# Altium schematic sheet 02_10_POWER_INPUT.SchDoc
size 289 x 396 mm
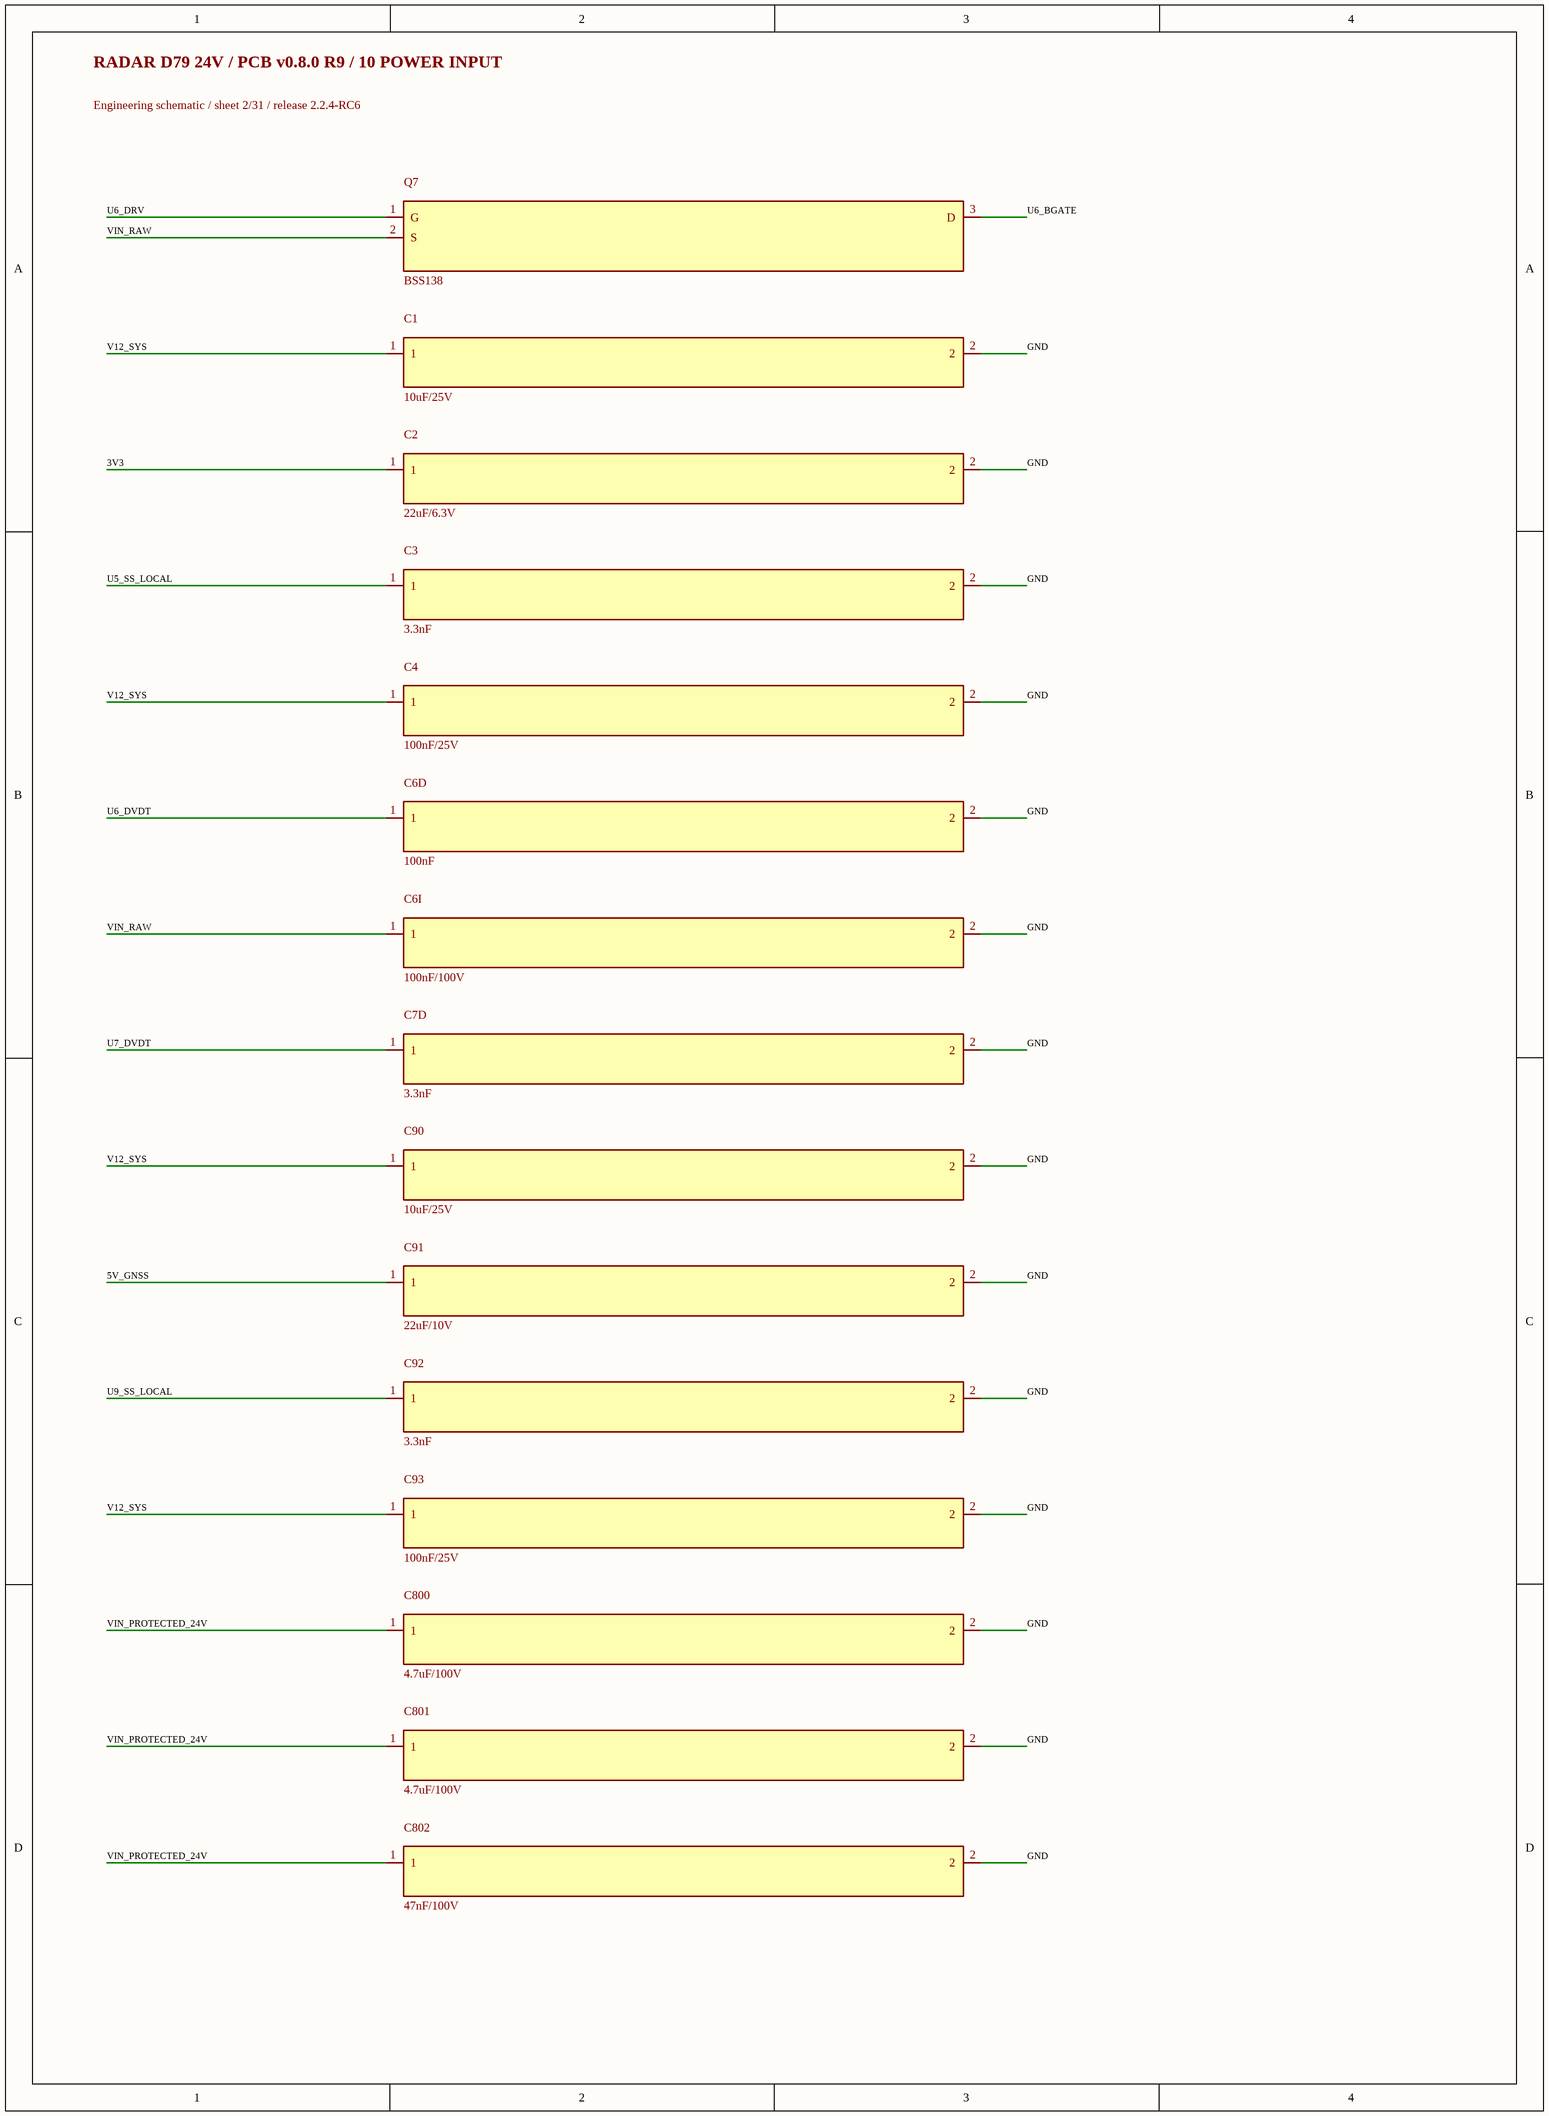
[diagram p0: 02_10_POWER_INPUT.SchDoc]

## Parts
C1  10uF/25V  [C_1206_3216Metric]
C2  22uF/6.3V  [C_1206_3216Metric]
C3  3.3nF  [C_0603_1608Metric]
C4  100nF/25V  [C_0603_1608Metric]
C6D  100nF  [C_0603_1608Metric]
C6I  100nF/100V  [C_0603_1608Metric]
C7D  3.3nF  [C_0603_1608Metric]
C90  10uF/25V  [C_1206_3216Metric]
C91  22uF/10V  [C_1206_3216Metric]
C92  3.3nF  [C_0603_1608Metric]
C93  100nF/25V  [C_0603_1608Metric]
C800  4.7uF/100V  [C_1210_3225Metric]
C801  4.7uF/100V  [C_1210_3225Metric]
C802  47nF/100V  [C_0603_1608Metric]
Q7  BSS138  [SOT-23]

## Nets
3V3: C2.1
5V_GNSS: C91.1
GND: C1.2 C2.2 C3.2 C4.2 C6D.2 C6I.2 C7D.2 C90.2 C91.2 C92.2 C93.2 C800.2 C801.2 C802.2
U5_SS_LOCAL: C3.1
U6_BGATE: Q7.3(D)
U6_DRV: Q7.1(G)
U6_DVDT: C6D.1
U7_DVDT: C7D.1
U9_SS_LOCAL: C92.1
V12_SYS: C1.1 C4.1 C90.1 C93.1
VIN_PROTECTED_24V: C800.1 C801.1 C802.1
VIN_RAW: C6I.1 Q7.2(S)

## Notes on the sheet
- RADAR D79 24V / PCB v0.8.0 R9 / 10 POWER INPUT
- Engineering schematic / sheet 2/31 / release 2.2.4-RC6